# Altium schematic sheet radar sch.SchDoc
size A4; SheetNumber: 3; SheetTotal: 4
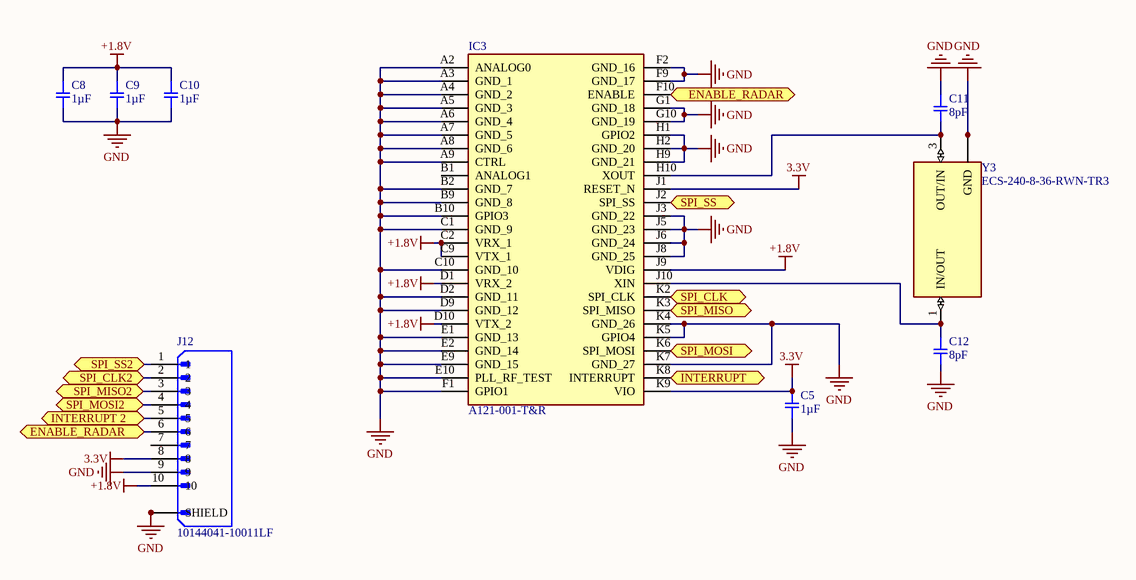
[diagram p0: radar sch.SchDoc]

## Parts
C5  1µF  [SMD-0402C]
C8  1µF  [SMD-0402C]
C9  1µF  [SMD-0402C]
C10  1µF  [SMD-0402C]
C11  8pF  [SMD-0402C]
C12  8pF  [SMD-0402C]
IC3  A121-001-T&R  [A121001TR]
J12  10144041-10011LF  [AMPHENOL_10144041-10011LF]
Y3  ECS-240-8-36-RWN-TR3  [XTAL_ECS-240-8-36-RWN-TR3]

## Ports
ENABLE_RADAR (bidir), INTERRUPT 2 (bidir), INTERRUPT (bidir), SPI_CLK2 (bidir), SPI_CLK (bidir), SPI_MISO2 (bidir), SPI_MISO (bidir), SPI_MOSI2 (bidir), SPI_MOSI (bidir), SPI_SS2 (bidir), SPI_SS (bidir)

## Nets
3.3V: C5.1 IC3.J1(RESET_N) IC3.K9(VIO) J12.8
+1.8V: C8.1 C9.1 C10.1 IC3.C2(VRX_1) IC3.C9(VTX_1) IC3.D1(VRX_2) IC3.D10(VTX_2) IC3.J9(VDIG) J12.10
GND: C5.2 C8.2 C9.2 C10.2 C11.1 C12.2 IC3.A2(ANALOG0) IC3.A3(GND_1) IC3.A4(GND_2) IC3.A5(GND_3) IC3.A6(GND_4) IC3.A7(GND_5) IC3.A8(GND_6) IC3.A9(CTRL) IC3.B2(GND_7) IC3.B9(GND_8) IC3.B10(GPIO3) IC3.C1(GND_9) IC3.C10(GND_10) IC3.D2(GND_11) IC3.D9(GND_12) IC3.E1(GND_13) IC3.E2(GND_14) IC3.E9(GND_15) IC3.E10(PLL_RF_TEST) IC3.F1(GPIO1) IC3.F2(GND_16) IC3.F9(GND_17) IC3.G1(GND_18) IC3.G10(GND_19) IC3.H1(GPIO2) IC3.H2(GND_20) IC3.H9(GND_21) IC3.J3(GND_22) IC3.J5(GND_23) IC3.J6(GND_24) IC3.J8(GND_25) IC3.K4(GND_26) IC3.K5(GPIO4) IC3.K7(GND_27) J12.9 J12.S1(SHIELD) J12.S2(SHIELD) Y3.2(GND) Y3.4(GND)
ENABLE_RADAR: IC3.F10(ENABLE) J12.6 ; port ENABLE_RADAR
INTERRUPT: IC3.K8(INTERRUPT) ; port INTERRUPT
INTERRUPT 2: J12.5 ; port INTERRUPT 2
SPI_CLK: IC3.K2(SPI_CLK) ; port SPI_CLK
SPI_CLK2: J12.2 ; port SPI_CLK2
SPI_MISO: IC3.K3(SPI_MISO) ; port SPI_MISO
SPI_MISO2: J12.3 ; port SPI_MISO2
SPI_MOSI: IC3.K6(SPI_MOSI) ; port SPI_MOSI
SPI_MOSI2: J12.4 ; port SPI_MOSI2
SPI_SS: IC3.J2(SPI_SS) ; port SPI_SS
SPI_SS2: J12.1 ; port SPI_SS2
NetC11_2: C11.2 IC3.H10(XOUT) Y3.3(OUT/IN)
NetC12_1: C12.1 IC3.J10(XIN) Y3.1(IN/OUT)

Not connected (* = marked no-connect by the designer): IC3 B1(ANALOG1); J12 7

## Notes on the sheet
- Title:
- Project:
- Date:
- Time:
- Sheet
- Size:
- A4
- Of
- Designed By:
- File:
- Shourav.EEE015@gmail.com
- Shourav Sarkar
- Rev:

## Library data of the parts
C5 C8-C10 = GCM155C71A105KE38D: CAP CER 1UF 10V X7S 0402; Manufacturer: Murata Electronics North America; Factory Stock: 0; Unit Price (USD): 0.12; Minimum Quantity: 1; Tolerance: ±10%; Datasheets: http://www.murata.com/~/media/webrenewal/support/library/catalog/products/capacitor/mlcc/c03e.ashx; Image: //media.digikey.com/Renders/Murata%20Renders/ZRB-SERIES-0402.jpg; Digi-Key Part Number: 490-13409-1-ND; Part Number: GCM155C71A105KE38D; Quantity Available: 7240; @ qty: 0; Packaging: Cut Tape (CT); Series: GCM; Part Status: Active; Value: 1µF; Voltage: 10V; Temperature Coefficient: X7S; Operating Temperature: -55°C ~ 125°C; Features: -; Ratings: AEC-Q200; Applications: Automotive; Mounting Type: Surface Mount, MLCC; Package / Case: 0402 (1005 Metric); Size / Dimension: 0.039" L x 0.020" W (1.00mm x 0.50mm); Height - Seated (Max): -; Thickness (Max): 0.022" (0.55mm); Lead Spacing: -; Lead Style: -
C11 C12 = GRM1555C1H8R0BA01D: CAP CER 8PF 50V NP0 0402; Manufacturer: Murata Electronics North America; Factory Stock: 0; Unit Price (USD): 0.1; Minimum Quantity: 1; Tolerance: ±0.1pF; Temperature Coefficient: C0G, NP0; Datasheets: http://www.murata.com/~/media/webrenewal/support/library/catalog/products/capacitor/mlcc/c02e.pdf; Image: //media.digikey.com/Renders/Murata%20Renders/ZRB-SERIES-0402.jpg; Digi-Key Part Number: 490-8230-1-ND; Part Number: GRM1555C1H8R0BA01D; Quantity Available: 3665; @ qty: 0; Packaging: Cut Tape (CT); Series: GRM; Part Status: Active; Value: 8pF; Voltage: 50V; Operating Temperature: -55°C ~ 125°C; Features: -; Ratings: -; Applications: General Purpose; Mounting Type: Surface Mount, MLCC; Package / Case: 0402 (1005 Metric); Size / Dimension: 0.039" L x 0.020" W (1.00mm x 0.50mm); Height - Seated (Max): -; Thickness (Max): 0.022" (0.55mm); Lead Spacing: -; Lead Style: -
IC3 = A121-001-T&R: Integrated Circuit; Manufacturer_Name: Acconeer AB; Datasheet Link: https://gr.mouser.com/datasheet/2/1126/A121_datasheet-3133196.pdf; Height: 0.899mm; Manufacturer_Part_Number: A121-001-T&R; Mouser Part Number: 925-A121-001-T&R; Mouser Price/Stock: https://www.mouser.co.uk/ProductDetail/Acconeer/A121-001-TR?qs=amGC7iS6iy%2F9krRiPHmNkQ%3D%3D
J12 = 10144041-10011LF: MF: {'manufacturer': u'Amphenol ICC (FCI)'}; Package: None; Price: None; Value: *; MP: 10144041-10011LF; Availability: Unavailable
Y3 = ECS-240-8-36-RWN-TR3: MF: {'manufacturer': u'ECS Inc.'}; Package: None; Price: None; Value: *; MP: ECS-240-8-36-RWN-TR3; Availability: Unavailable